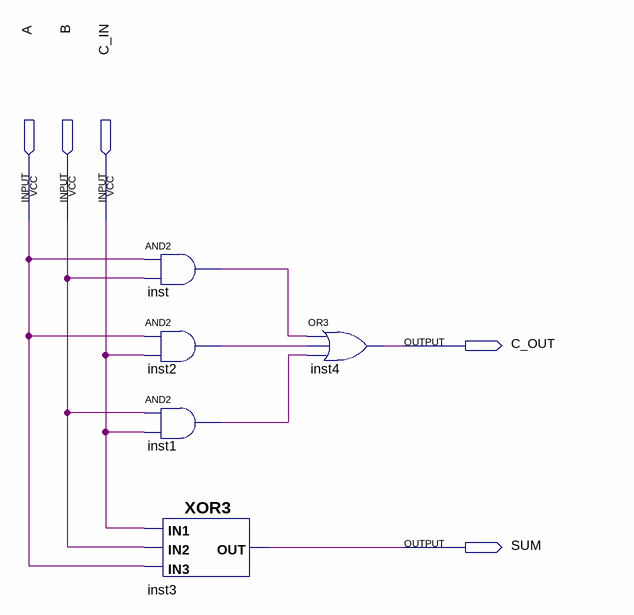
[diagram p0: schematic sheet]
// Quartus schematic FullAdder.bdf as structural Verilog: 5 symbols, 5 pins
module FullAdder (
  input  A,
  input  B,
  input  C_IN,
  output C_OUT,
  output SUM
);

  wire inst1_out, inst2_out, inst_out;

  and inst (inst_out, A, B);
  and inst2 (inst2_out, A, C_IN);
  and inst1 (inst1_out, B, C_IN);
  XOR3 inst3 (.IN3(A), .IN1(C_IN), .IN2(B), .OUT(SUM));
  or inst4 (C_OUT, inst_out, inst2_out, inst1_out);
endmodule
